# Altium schematic sheet Sources.SchDoc
size A4; SheetNumber: 1; SheetTotal: 7
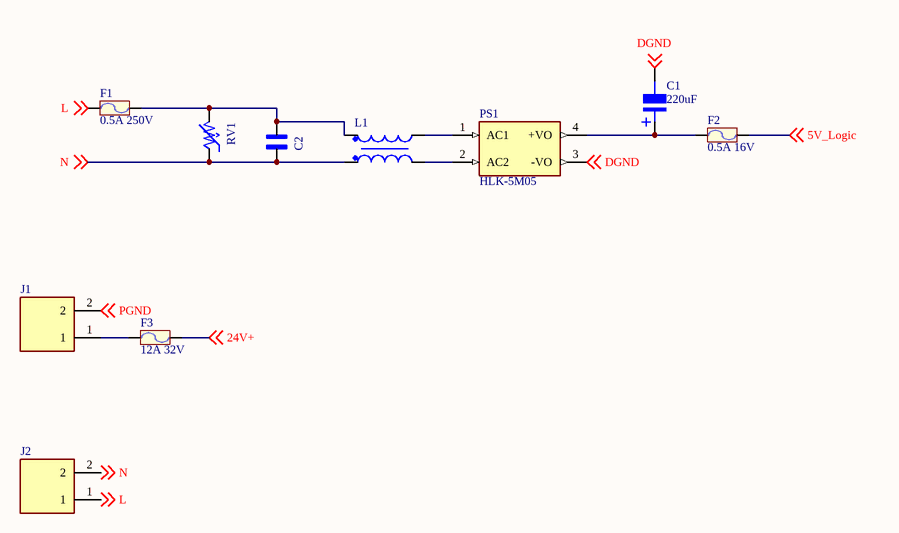
[diagram p0: Sources.SchDoc]

## Parts
C1  220uF  [tu nhom 8 (e)]
C2  R46KI315050M2K  [CAPRR1500W60L1800T600H1210]  (value not drawn)
F1  0.5A 250V  [Cau Chi SMD1808]
F2  0.5A 16V  [Cau Chi SMD1808]
F3  12A 32V  [Cau Chi SMD1808]
J1  KF301-2P  [HANDSON_KF301-2P]  (value not drawn)
J2  KF301-2P  [HANDSON_KF301-2P]  (value not drawn)
L1  WE-CMB_XS  [WE-CMB_XS]  (value not drawn)
PS1  HLK-5M05  [CONV_HLK-5M05]
RV1  MOV-10D561K  [VAR_MOV-10D561K]  (value not drawn)

## Nets
5V_Logic: F2.2 ; off-sheet 5V_Logic
24V+: F3.2 ; off-sheet 24V+
DGND: C1.2 PS1.3(-VO) ; off-sheet DGND
L: F1.1 J2.1 ; off-sheet L
N: C2.2 J2.2 L1.2 RV1.1 ; off-sheet N
PGND: J1.2 ; off-sheet PGND
NetC1_1: C1.1 F2.1 PS1.4(+VO)
NetC2_1: C2.1 F1.2 L1.1 RV1.2
NetF3_1: F3.1 J1.1
NetL1_3: L1.3 PS1.2(AC2)
NetL1_4: L1.4 PS1.1(AC1)

## Notes on the sheet
- (in symbol Tu Nhom 220uF 10V) +

## Library data of the parts
C1 = Tu Nhom 220uF 10V: Dán; So_Chan: 2; Ten_Linh_Kien: Tụ Nhôm 220uF 10V; Ma_Hang: MH004021; Don_Vi: Con; Chung_Loai: Dán; Kieu_Chan: *
C2 = R46KI315050M2K: 0.15 ÂµF Film Capacitor 275V 560V Polypropylene (PP), Metallized Radial; MF: KEMET; SnapEDA_Link: https://www.snapeda.com/parts/R46KI315050M2K/KEMET/view-part/?ref=snap; Package: RADIAL-2 KEMET; Value: *; MP: R46KI315050M2K; Check_prices: https://www.snapeda.com/parts/R46KI315050M2K/KEMET/view-part/?ref=eda
F1-F3 = Cau chi 0.5A 125V SMD1808: Ma_Hang: MH009241; Ten: Cầu Chì 0.5A 125V SMD1808 0451.500MRL
J1 J2 = KF301-2P: 2 Pin Terminal Block 5mm Pitch; MF: Handson Technology; SnapEDA_Link: https://www.snapeda.com/parts/KF301-2P/Handson+Technology/view-part/?ref=snap; Package: None; Value: *; MP: KF301-2P; Check_prices: https://www.snapeda.com/parts/KF301-2P/Handson+Technology/view-part/?ref=eda
L1 = WE-CMB_XS: Size Typ XS; L = 10 mH; IR = 0.7 A; RDC = 350 mâ„¦; MF: Wurth Electronics; MP: 744821110; SnapEDA_Link: https://www.snapeda.com/parts/744821110/Wurth+Electronics/view-part/?ref=snap; Package: Vertical-4 WÃ¼rth Elektronik; Value: *; Check_prices: https://www.snapeda.com/parts/744821110/Wurth+Electronics/view-part/?ref=eda
PS1 = HLK-5M05: AC DC 220V to 5V 5W 5Watt Isolated Switching Step-Down Power Supply Module Converter; MF: Hi-link; Check_prices: https://www.snapeda.com/parts/HLK-5M05/Hi-link/view-part/?ref=eda; SnapEDA_Link: https://www.snapeda.com/parts/HLK-5M05/Hi-link/view-part/?ref=snap; Price: None; Availability: Not in stock; Package: Package; MP: HLK-5M05; Value: *
RV1 = MOV-10D561K: 560 V 2.5 kA Varistor 1 Circuit Through Hole Disc 10mm; MF: Bourns; SnapEDA_Link: https://www.snapeda.com/parts/MOV-10D561K/Bourns/view-part/?ref=snap; Package: Package; Value: *; MP: MOV-10D561K; Check_prices: https://www.snapeda.com/parts/MOV-10D561K/Bourns/view-part/?ref=eda